# Altium schematic sheet RK3588-HDMI-Connector.SchDoc
size 420 x 297 mm; SheetNumber: 18; SheetTotal: 22
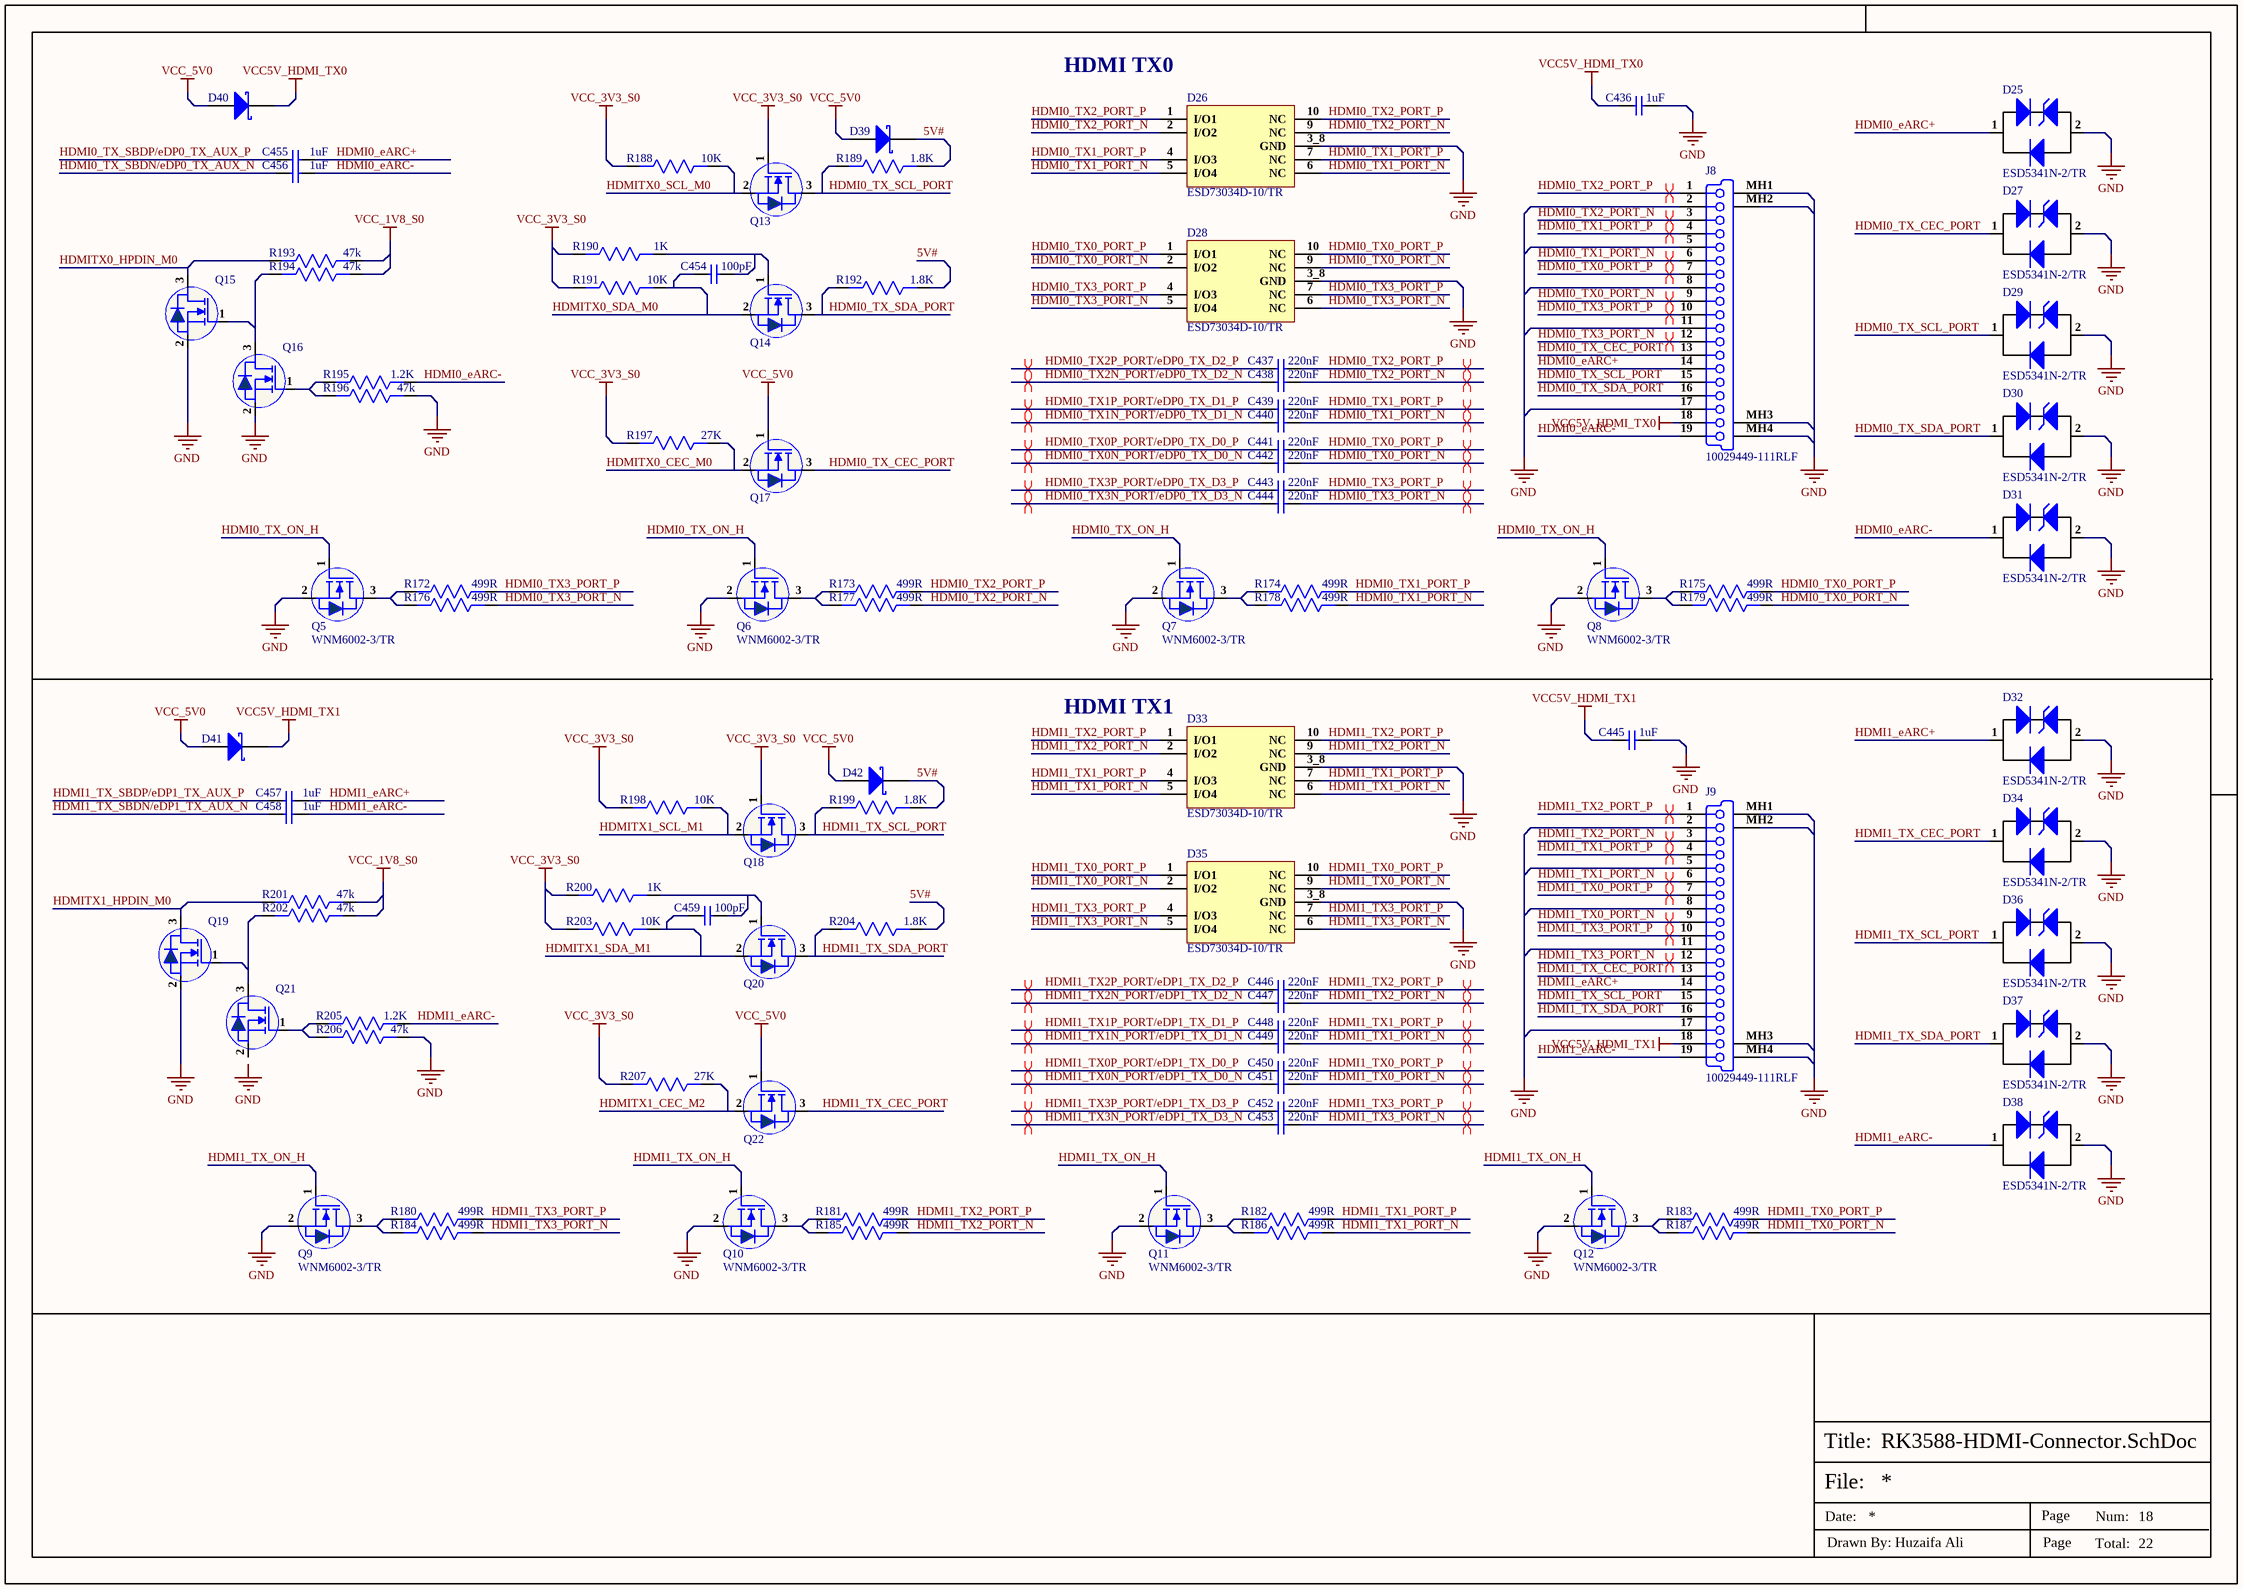
[diagram p0: RK3588-HDMI-Connector.SchDoc]

## Parts
C436  1uF  [Cap-0402]
C437  220nF  [CAP-0201]
C438  220nF  [CAP-0201]
C439  220nF  [CAP-0201]
C440  220nF  [CAP-0201]
C441  220nF  [CAP-0201]
C442  220nF  [CAP-0201]
C443  220nF  [CAP-0201]
C444  220nF  [CAP-0201]
C445  1uF  [Cap-0402]
C446  220nF  [CAP-0201]
C447  220nF  [CAP-0201]
C448  220nF  [CAP-0201]
C449  220nF  [CAP-0201]
C450  220nF  [CAP-0201]
C451  220nF  [CAP-0201]
C452  220nF  [CAP-0201]
C453  220nF  [CAP-0201]
C454  100pF  [Cap-0402]
C455  1uF  [Cap-0201]
C456  1uF  [Cap-0201]
C457  1uF  [Cap-0201]
C458  1uF  [Cap-0201]
C459  100pF  [Cap-0402]
D25  ESD5341N-2/TR  [DFN1006-2L_]
D26  ESD73034D-10/TR  [DFN2510-10L_]
D27  ESD5341N-2/TR  [DFN1006-2L_]
D28  ESD73034D-10/TR  [DFN2510-10L_]
D29  ESD5341N-2/TR  [DFN1006-2L_]
D30  ESD5341N-2/TR  [DFN1006-2L_]
D31  ESD5341N-2/TR  [DFN1006-2L_]
D32  ESD5341N-2/TR  [DFN1006-2L_]
D33  ESD73034D-10/TR  [DFN2510-10L_]
D34  ESD5341N-2/TR  [DFN1006-2L_]
D35  ESD73034D-10/TR  [DFN2510-10L_]
D36  ESD5341N-2/TR  [DFN1006-2L_]
D37  ESD5341N-2/TR  [DFN1006-2L_]
D38  ESD5341N-2/TR  [DFN1006-2L_]
D39  B5819WS  [SOD-323]  (value not drawn)
D40  B5819WS  [SOD-323]  (value not drawn)
D41  B5819WS  [SOD-323]  (value not drawn)
D42  B5819WS  [SOD-323]  (value not drawn)
J8  10029449-111RLF  [10029449-111RLF]
J9  10029449-111RLF  [10029449-111RLF]
Q5  WNM6002-3/TR  [SOT_323]
Q6  WNM6002-3/TR  [SOT_323]
Q7  WNM6002-3/TR  [SOT_323]
Q8  WNM6002-3/TR  [SOT_323]
Q9  WNM6002-3/TR  [SOT_323]
Q10  WNM6002-3/TR  [SOT_323]
Q11  WNM6002-3/TR  [SOT_323]
Q12  WNM6002-3/TR  [SOT_323]
Q13  2SK3018T106  [SOT_323]  (value not drawn)
Q14  2SK3018T106  [SOT_323]  (value not drawn)
Q15  2SK3018T106  [SOT_323]  (value not drawn)
Q16  2SK3018T106  [SOT_323]  (value not drawn)
Q17  2SK3018T106  [SOT_323]  (value not drawn)
Q18  2SK3018T106  [SOT_323]  (value not drawn)
Q19  2SK3018T106  [SOT_323]  (value not drawn)
Q20  2SK3018T106  [SOT_323]  (value not drawn)
Q21  2SK3018T106  [SOT_323]  (value not drawn)
Q22  2SK3018T106  [SOT_323]  (value not drawn)
R172  499R  [Res-0201]
R173  499R  [Res-0201]
R174  499R  [Res-0201]
R175  499R  [Res-0201]
R176  499R  [Res-0201]
R177  499R  [Res-0201]
R178  499R  [Res-0201]
R179  499R  [Res-0201]
R180  499R  [Res-0201]
R181  499R  [Res-0201]
R182  499R  [Res-0201]
R183  499R  [Res-0201]
R184  499R  [Res-0201]
R185  499R  [Res-0201]
R186  499R  [Res-0201]
R187  499R  [Res-0201]
R188  10K  [Res-0402]
R189  1.8K  [Res-0402]
R190  1K  [Res-0402]
R191  10K  [Res-0402]
R192  1.8K  [Res-0402]
R193  47k  [Res-0402]
R194  47k  [Res-0402]
R195  1.2K  [Res-0402]
R196  47k  [Res-0402]
R197  27K  [Res-0402]
R198  10K  [Res-0402]
R199  1.8K  [Res-0402]
R200  1K  [Res-0402]
R201  47k  [Res-0402]
R202  47k  [Res-0402]
R203  10K  [Res-0402]
R204  1.8K  [Res-0402]
R205  1.2K  [Res-0402]
R206  47k  [Res-0402]
R207  27K  [Res-0402]

## Nets
GND: C436.2 C445.2 D25.2(A) D26.3_8(GND) D27.2(A) D28.3_8(GND) D29.2(A) D30.2(A) D31.2(A) D32.2(A) D33.3_8(GND) D34.2(A) D35.3_8(GND) D36.2(A) D37.2(A) D38.2(A) J8.2 J8.5 J8.8 J8.11 J8.17 J8.MH1(Tab) J8.MH2(Tab) J8.MH3(Tab) J8.MH4(Tab) J9.2 J9.5 J9.8 J9.11 J9.17 J9.MH1(Tab) J9.MH2(Tab) J9.MH3(Tab) J9.MH4(Tab) Q5.2(S) Q6.2(S) Q7.2(S) Q8.2(S) Q9.2(S) Q10.2(S) Q11.2(S) Q12.2(S) Q15.2(S) Q16.2(S) Q19.2(S) R196.1 R206.1
VCC5V_HDMI_TX0: C436.1 D40.1(K) J8.18
VCC5V_HDMI_TX1: C445.1 D41.1(K) J9.18
VCC_1V8_S0: R193.1 R194.1 R201.1 R202.1
VCC_3V3_S0: Q13.1(G) Q18.1(G) R188.2 R190.2 R191.2 R197.2 R198.2 R200.2 R203.2 R207.2
VCC_5V0: D39.2(A) D40.2(A) D41.2(A) D42.2(A) Q17.1(G) Q22.1(G)
5V#: D39.1(K) D42.1(K) R189.1 R192.1 R199.1 R204.1
HDMI0_eARC+: C455.2 D25.1(K) J8.14
HDMI0_eARC-: C456.2 D31.1(K) J8.19 R195.1
HDMI0_TX0_PORT_N: C442.2 D28.2(I/O2) D28.9(NC) J8.9 R179.1
HDMI0_TX0_PORT_P: C441.2 D28.1(I/O1) D28.10(NC) J8.7 R175.1
HDMI0_TX0N_PORT/eDP0_TX_D0_N: C442.1
HDMI0_TX0P_PORT/eDP0_TX_D0_P: C441.1
HDMI0_TX1_PORT_N: C440.2 D26.5(I/O4) D26.6(NC) J8.6 R178.1
HDMI0_TX1_PORT_P: C439.2 D26.4(I/O3) D26.7(NC) J8.4 R174.1
HDMI0_TX1N_PORT/eDP0_TX_D1_N: C440.1
HDMI0_TX1P_PORT/eDP0_TX_D1_P: C439.1
HDMI0_TX2_PORT_N: C438.2 D26.2(I/O2) D26.9(NC) J8.3 R177.1
HDMI0_TX2_PORT_P: C437.2 D26.1(I/O1) D26.10(NC) J8.1 R173.1
HDMI0_TX2N_PORT/eDP0_TX_D2_N: C438.1
HDMI0_TX2P_PORT/eDP0_TX_D2_P: C437.1
HDMI0_TX3_PORT_N: C444.2 D28.5(I/O4) D28.6(NC) J8.12 R176.1
HDMI0_TX3_PORT_P: C443.2 D28.4(I/O3) D28.7(NC) J8.10 R172.1
HDMI0_TX3N_PORT/eDP0_TX_D3_N: C444.1
HDMI0_TX3P_PORT/eDP0_TX_D3_P: C443.1
HDMI0_TX_CEC_PORT: D27.1(K) J8.13 Q17.3(D)
HDMI0_TX_ON_H: Q5.1(G) Q6.1(G) Q7.1(G) Q8.1(G)
HDMI0_TX_SBDN/eDP0_TX_AUX_N: C456.1
HDMI0_TX_SBDP/eDP0_TX_AUX_P: C455.1
HDMI0_TX_SCL_PORT: D29.1(K) J8.15 Q13.3(D) R189.2
HDMI0_TX_SDA_PORT: D30.1(K) J8.16 Q14.3(D) R192.2
HDMI1_eARC+: C457.2 D32.1(K) J9.14
HDMI1_eARC-: C458.2 D38.1(K) J9.19 R205.1
HDMI1_TX0_PORT_N: C451.2 D35.2(I/O2) D35.9(NC) J9.9 R187.1
HDMI1_TX0_PORT_P: C450.2 D35.1(I/O1) D35.10(NC) J9.7 R183.1
HDMI1_TX0N_PORT/eDP1_TX_D0_N: C451.1
HDMI1_TX0P_PORT/eDP1_TX_D0_P: C450.1
HDMI1_TX1_PORT_N: C449.2 D33.5(I/O4) D33.6(NC) J9.6 R186.1
HDMI1_TX1_PORT_P: C448.2 D33.4(I/O3) D33.7(NC) J9.4 R182.1
HDMI1_TX1N_PORT/eDP1_TX_D1_N: C449.1
HDMI1_TX1P_PORT/eDP1_TX_D1_P: C448.1
HDMI1_TX2_PORT_N: C447.2 D33.2(I/O2) D33.9(NC) J9.3 R185.1
HDMI1_TX2_PORT_P: C446.2 D33.1(I/O1) D33.10(NC) J9.1 R181.1
HDMI1_TX2N_PORT/eDP1_TX_D2_N: C447.1
HDMI1_TX2P_PORT/eDP1_TX_D2_P: C446.1
HDMI1_TX3_PORT_N: C453.2 D35.5(I/O4) D35.6(NC) J9.12 R184.1
HDMI1_TX3_PORT_P: C452.2 D35.4(I/O3) D35.7(NC) J9.10 R180.1
HDMI1_TX3N_PORT/eDP1_TX_D3_N: C453.1
HDMI1_TX3P_PORT/eDP1_TX_D3_P: C452.1
HDMI1_TX_CEC_PORT: D34.1(K) J9.13 Q22.3(D)
HDMI1_TX_ON_H: Q9.1(G) Q10.1(G) Q11.1(G) Q12.1(G)
HDMI1_TX_SBDN/eDP1_TX_AUX_N: C458.1
HDMI1_TX_SBDP/eDP1_TX_AUX_P: C457.1
HDMI1_TX_SCL_PORT: D36.1(K) J9.15 Q18.3(D) R199.2
HDMI1_TX_SDA_PORT: D37.1(K) J9.16 Q20.3(D) R204.2
HDMITX0_CEC_M0: Q17.2(S) R197.1
HDMITX0_HPDIN_M0: Q15.3(D) R193.2
HDMITX0_SCL_M0: Q13.2(S) R188.1
HDMITX0_SDA_M0: C454.1 Q14.2(S) R191.1
HDMITX1_CEC_M2: Q22.2(S) R207.1
HDMITX1_HPDIN_M0: Q19.3(D) R201.2
HDMITX1_SCL_M1: Q18.2(S) R198.1
HDMITX1_SDA_M1: C459.1 Q20.2(S) R203.1
NetC454_2: C454.2 Q14.1(G) R190.1
NetC459_2: C459.2 Q20.1(G) R200.1
NetQ5_3: Q5.3(D) R172.2 R176.2
NetQ6_3: Q6.3(D) R173.2 R177.2
NetQ7_3: Q7.3(D) R174.2 R178.2
NetQ8_3: Q8.3(D) R175.2 R179.2
NetQ9_3: Q9.3(D) R180.2 R184.2
NetQ10_3: Q10.3(D) R181.2 R185.2
NetQ11_3: Q11.3(D) R182.2 R186.2
NetQ12_3: Q12.3(D) R183.2 R187.2
NetQ15_1: Q15.1(G) Q16.3(D) R194.2
NetQ16_1: Q16.1(G) R195.2 R196.2
NetQ19_1: Q19.1(G) Q21.3(D) R202.2
NetQ21_1: Q21.1(G) R205.2 R206.2

Not connected (* = marked no-connect by the designer): Q21 2(S)

## Layout directives
differential pair: HDMI0_TX0_PORT_N, HDMI0_TX0_PORT_P, HDMI0_TX0N_PORT/eDP0_TX_D0_N, HDMI0_TX0P_PORT/eDP0_TX_D0_P, HDMI0_TX1_PORT_N, HDMI0_TX1_PORT_P, HDMI0_TX1N_PORT/eDP0_TX_D1_N, HDMI0_TX1P_PORT/eDP0_TX_D1_P, HDMI0_TX2_PORT_N, HDMI0_TX2_PORT_P, HDMI0_TX2N_PORT/eDP0_TX_D2_N, HDMI0_TX2P_PORT/eDP0_TX_D2_P, HDMI0_TX3_PORT_N, HDMI0_TX3_PORT_P, HDMI0_TX3N_PORT/eDP0_TX_D3_N, HDMI0_TX3P_PORT/eDP0_TX_D3_P, HDMI1_TX0_PORT_N, HDMI1_TX0_PORT_P, HDMI1_TX0N_PORT/eDP1_TX_D0_N, HDMI1_TX0P_PORT/eDP1_TX_D0_P, HDMI1_TX1_PORT_N, HDMI1_TX1_PORT_P, HDMI1_TX1N_PORT/eDP1_TX_D1_N, HDMI1_TX1P_PORT/eDP1_TX_D1_P, HDMI1_TX2_PORT_N, HDMI1_TX2_PORT_P, HDMI1_TX2N_PORT/eDP1_TX_D2_N, HDMI1_TX2P_PORT/eDP1_TX_D2_P, HDMI1_TX3_PORT_N, HDMI1_TX3_PORT_P, HDMI1_TX3N_PORT/eDP1_TX_D3_N, HDMI1_TX3P_PORT/eDP1_TX_D3_P

## Notes on the sheet
- (near D26) HDMI TX0
- (near D33) HDMI TX1
- Labels drawn without touching a wire or pin: GND
- File:
- Title:
- Date:
- Page
- Num:
- Total:
- Drawn By: Huzaifa Ali

## Library data of the parts
C436 C445 = CC0402KRX5R6BB105: CAP CER 1UF 10V X5R 0402; Manufacturer: Yageo; Tolerance: 10%; Dissipation Factor: 15%; Supplier 1: Mouser; Manufacturer Part Number: CC0402KRX5R6BB105; RoHS: Yes; Category: Ceramic Capacitors; Stock 1: 6711367; Pricing 1: 1=0.11000, 10=0.05500, 50=0.05500, 100=0.03300, 500=0.02700, 1000=0.02200, 2500=0.02100, 10000=0.01800 (USD); Mount: Surface Mount; Case/Package: 0402; Number of Pins: 2; Case Code (Metric): 1005; Case Code (Imperial): 0402; Min Operating Temperature: -55°C; Max Operating Temperature: 85°C; Capacitance: 1uF; Dielectric: X5R; Package Quantity: 1; Voltage Rating: 10V; Packaging: Tape and Reel; Voltage Rating (DC): 10V; Termination: SMD/SMT; Resistor Type: Ceramic; Series: CC; Construction: Flat; Length: 1mm; Width: 0.02inch; Height: 0.5mm; Thickness: 0.022inch; Depth: 0.5mm; Radiation Hardening: No; REACH SVHC: No SVHC; Lead Free: Lead Free; Halogen Free: Halogen Free; RoHS Compliant: Yes; ComponentLink1URL: https://datasheet.ciiva.com/176/upy-gphc-x5r-4v-to-50v-12-176704.pdf?src-supplier=Digi-Key; ComponentLink1Description: https://datasheet.ciiva.com/176/upy-gphc-x5r-4v-to-50v-12-176704.pdf?src-supplier=Digi-Key; ComponentLink2URL: https://datasheet.ciiva.com/176/mlccorderingcode-176705.pdf?src-supplier=Digi-Key; ComponentLink2Description: https://datasheet.ciiva.com/176/mlccorderingcode-176705.pdf?src-supplier=Digi-Key; ComponentLink3URL: https://datasheet.ciiva.com/176/mlccorderingcode-176706.pdf?src-supplier=Digi-Key; ComponentLink3Description: https://datasheet.ciiva.com/176/mlccorderingcode-176706.pdf?src-supplier=Digi-Key; Supplier Part Number 1: 603-CC402KRX5R6BB105; LCSC Part Number: C106254
C437-C444 C446-C453 = CC0201KRX5R6BB224: CAP CER 0.22UF 10V X5R 0201; Manufacturer: Yageo; Supplier 1: Digi-Key; Manufacturer Part Number: CC0201KRX5R6BB224; RoHS: Yes; Category: Ceramic Capacitors; Stock 1: 4746; Pricing 1: 1=0.10000, 10=0.06700, 50=0.03640, 100=0.02970, 500=0.02120, 1000=0.01666, 2500=0.01515, 5000=0.01394 (USD); RoHS Compliant: Yes; Supplier Part Number 1: 13-CC0201KRX5R6BB224CT-ND
C454 C459 = GRM1555C1H101JA01D: CAP CER 100PF 50V C0G/NP0 0402; Manufacturer: Murata; Material: Ceramic; Dielectric: C0G; Tolerance: 5%; Supplier 1: Mouser; Manufacturer Part Number: GRM1555C1H101JA01D; RoHS: Yes; Category: Ceramic Capacitors; Stock 1: 2073105; Pricing 1: 1=0.10000, 10=0.01000, 50=0.01000, 100=0.00900, 500=0.00600, 1000=0.00500, 2500=0.00400, 10000=0.00300, 50000=0.00200 (USD); Mount: Surface Mount; Case/Package: 0402; Case Code (Metric): 1005; Case Code (Imperial): 0402; Min Operating Temperature: -55°C; Max Operating Temperature: 125°C; Voltage Rating: 50V; Capacitance: 100pF; Packaging: Tape and Reel; Package Quantity: 1; Voltage Rating (DC): 50V; Termination: SMD/SMT; Series: GRM; Construction: Flat; Voltage: 50V; Length: 1mm; Width: 0.02inch; Height: 0.5mm; Thickness: 0.022inch; Depth: 0.5mm; Radiation Hardening: No; REACH SVHC: No SVHC; Lead Free: Lead Free; RoHS Compliant: Yes; ComponentLink1URL: https://datasheet.ciiva.com/11786/0900766b80ef921d-11786069.pdf?src-supplier=RSComponents; ComponentLink1Description: https://datasheet.ciiva.com/11786/0900766b80ef921d-11786069.pdf?src-supplier=RSComponents; ComponentLink2URL: https://datasheet.ciiva.com/18184/getdatasheetpartid-199957-18184175.pdf?src-supplier=Verical; ComponentLink2Description: https://datasheet.ciiva.com/18184/getdatasheetpartid-199957-18184175.pdf?src-supplier=Verical; ComponentLink3URL: https://datasheet.ciiva.com/29200/453557-da-01-en-vs-kondensator-0402-29200111.pdf?src-supplier=Conrad; ComponentLink3Description: https://datasheet.ciiva.com/29200/453557-da-01-en-vs-kondensator-0402-29200111.pdf?src-supplier=Conrad; ComponentLink4URL: https://datasheet.ciiva.com/6271/partnumbering-e-01-6271071.pdf?src-supplier=Digi-Key; ComponentLink4Description: https://datasheet.ciiva.com/6271/partnumbering-e-01-6271071.pdf?src-supplier=Digi-Key; ComponentLink5URL: https://datasheet.ciiva.com/16440/product-16440566.pdf?src-supplier=Future+Electronics; ComponentLink5Description: https://datasheet.ciiva.com/16440/product-16440566.pdf?src-supplier=Future+Electronics; Supplier Part Number 1: 81-GRM1555C1H101JA1D; LCSC Part Number: C77177
C455-C458 = CC0201KRX5R5BB105: CAP CER 1UF 6.3V X5R 0201; Manufacturer: Yageo; Tolerance: 10%; Item Type: Capacitor; Supplier 1: Arrow Electronics; Manufacturer Part Number: CC0201KRX5R5BB105; RoHS: Yes; Category: Ceramic Capacitors; Stock 1: 600000; Pricing 1: 15000=0.00740 (USD); Mount: Surface Mount; Case/Package: 0201; Case Code (Imperial): 0201; Case Code (Metric): 0603; Min Operating Temperature: -55°C; Max Operating Temperature: 85°C; Packaging: Cut Tape; Capacitance: 1uF; Voltage Rating: 6.3V; RoHS Compliant: Yes; ComponentLink1URL: http://www.yageo.com/documents/recent/UPY-GPHC_X5R_4V-to-50V_25.pdf?src-supplier=Digi-Key; ComponentLink1Description: http://www.yageo.com/documents/recent/UPY-GPHC_X5R_4V-to-50V_25.pdf?src-supplier=Digi-Key; ComponentLink2URL: https://www.yageo.com/upload/media/product/productsearch/datasheet/mlcc/UPY-GPHC_X5R_4V-to-50V_26.pdf?src-supplier=Digi-Key; ComponentLink2Description: https://www.yageo.com/upload/media/product/productsearch/datasheet/mlcc/UPY-GPHC_X5R_4V-to-50V_26.pdf?src-supplier=Digi-Key; Supplier Part Number 1: CC0201KRX5R5BB105; LCSC Part Number: C541330
D25 D27 D29-D32 D34 D36-D38 = ESD5341N-2/TR: 4A@8/20us 15V 7V 5V Unidirectional DFN1006-2L TVS ROHS; Manufacturer: WILLSEMI; Item Type: Diode; Manufacturer Part Number: ESD5341N-2/TR; Package: DFN1006-2L; ComponentLink1Description: LCSC; ComponentLink1URL: https://www.lcsc.com/product-detail/TVS_WILLSEMI-Will-Semicon-ESD5341N-2-TR_C239773.html; LCSC Part Number: C239773
D26 D28 D33 D35 = ESD73034D-10/TR: DFN2510-10L ESD Protection Devices ROHS; Manufacturer: WILLSEMI; Item Type: Diode; Manufacturer Part Number: ESD73034D-10/TR; Package: DFN2510-10L; LCSC Part Number: C2941834; ComponentLink1Description: LCSC; ComponentLink1URL: https://www.lcsc.com/product-detail/span-style-background-color-ff0-ESD-span-Protection-Devices_WILLSEMI-Will-Semicon-ESD73034D-10-TR_C2941834.html
D39-D42 = B5819WS: DIODE SCHOTTKY 40V 1A SOD323; Manufacturer: MDD; Manufacturer Part Number: B5819WS-TP; Max Surge Current: 10A; Forward Voltage: 900mV; Max Reverse Leakage Current: 1mA; Element Configuration: Single; Supplier 1: Arrow Electronics; RoHS: Yes; Category: Rectifier Diodes; Stock 1: 1701; Pricing 1: 1=0.34370, 10=0.18990, 25=0.18810, 100=0.11820, 250=0.11700, 500=0.08890, 1000=0.07420 (USD); Mount: Surface Mount; Number of Pins: 2; Min Operating Temperature: -65°C; Max Operating Temperature: 125°C; Package Quantity: 1; Packaging: Tape and Reel; Average Rectified Current: 1A; Peak Non-Repetitive Surge Current: 10A; Max Reverse Voltage (DC): 40V; Series: -; Radiation Hardening: No; RoHS Compliant: Yes; Lead Free: Lead Free; Supplier Part Number 1: B5819WS-TP; ComponentLink1Description: LCSC; ComponentLink1URL: https://lcsc.com/product-detail/Schottky-Barrier-Diodes-SBD_MDD-Microdiode-Electronics-B5819WS_C64886.html; LCSC Part Number: C22624; Item Type: Diode
J8 J9 = 10029449-111RLF: CONN RCPT 1.4 HDMI 19POS SMD R/A; Manufacturer: Amphenol ICC / FCI; Item Type: Connector; Supplier 1: RSComponents; Manufacturer Part Number: 10029449-111RLF; RoHS: No; Category: Audio / Video Connectors; Stock 1: 6150; Pricing 1: 1=1471.56000 (GBP); ComponentLink1URL: https://www.verical.com/server-webapp/html/getDatasheet?partID=416866&src-supplier=Verical; ComponentLink1Description: https://www.verical.com/server-webapp/html/getDatasheet?partID=416866&src-supplier=Verical; ComponentLink2URL: http://components.arrow.com/part/dataview/51683435S9285512N8314?src-supplier=Arrow+Electronics; ComponentLink2Description: http://components.arrow.com/part/dataview/51683435S9285512N8314?src-supplier=Arrow+Electronics; ComponentLink3URL: http://portal.fciconnect.com/Comergent/en/US/adirect/fci?cmd=catProductDetail&showAddButton=true&productID=10029449111RLF&src-supplier=Mouser; ComponentLink3Description: http://portal.fciconnect.com/Comergent/en/US/adirect/fci?cmd=catProductDetail&showAddButton=true&productID=10029449111RLF&src-supplier=Mouser; ComponentLink4URL: http://www.amphenol-icc.com/media/wysiwyg/files/drawing/10029449.pdf?src-supplier=Digi-Key; ComponentLink4Description: http://www.amphenol-icc.com/media/wysiwyg/files/drawing/10029449.pdf?src-supplier=Digi-Key; ComponentLink5URL: http://www.farnell.com/datasheets/2562284.pdf?src-supplier=Farnell; ComponentLink5Description: http://www.farnell.com/datasheets/2562284.pdf?src-supplier=Farnell; Supplier Part Number 1: 1822113; LCSC Part Number: C427307
Q5-Q12 = WNM6002-3/TR: 60V 300mA 2Ω@10V,370mA 370mW 2V@250uA N Channel SOT-323 MOSFETs ROHS; Manufacturer: WILLSEMI; Item Type: Mosfet; ComponentLink1Description: LCSC; ComponentLink1URL: https://www.lcsc.com/product-detail/MOSFETs_WILLSEMI-Will-Semicon-WNM6002-3-TR_C501342.html; Manufacturer Part Number: WNM6002-3/TR; Package: SOT-323; LCSC Part Number: C501342
Q13-Q22 = 2SK3018T106: MOSFET N-CH 30V .1A SOT-323; Manufacturer: Rohm; Rise Time: 35ns; Nominal Vgs: 1.5V; Rds On Max: 8R; Input Capacitance: 13pF; Continuous Drain Current (ID): 100mA; Power Dissipation: 200mW; Drain to Source Resistance: 7R; Turn-Off Delay Time: 80ns; Turn-On Delay Time: 15ns; Element Configuration: Single; Gate to Source Voltage (Vgs): 20V; On-State Resistance: 13R; Polarity: N-CHANNEL; Supplier 1: Digi-Key; Manufacturer Part Number: 2SK3018T106; RoHS: Yes; Category: MOSFETs; Stock 1: 35632; Pricing 1: 1=0.40000, 10=0.33100, 100=0.17560, 500=0.11550, 1000=0.07854 (USD); Mount: Surface Mount; Case/Package: SOT-323; Number of Pins: 3; Contact Plating: Copper,Tin,Silver; Min Operating Temperature: -55°C; Max Operating Temperature: 150°C; Package Quantity: 3000; Packaging: Tape and Reel; Dual Supply Voltage: 30V; Drain to Source Breakdown Voltage: 30V; Fall Time: 35ns; Drain to Source Voltage (Vdss): 30V; Max Power Dissipation: 200mW; Threshold Voltage: 1.5V; Termination: SMD/SMT; Voltage Rating (DC): 30V; Current Rating: 100mA; Drain-source On Resistance-Max: 13R; Series: -; Length: 2mm; Width: 1.25mm; Height: 0.8mm; Radiation Hardening: No; Reach SVHC Compliant: Yes; Lead Free: Lead Free; RoHS Compliant: Yes; ComponentLink1URL: https://datasheet.ciiva.com/16307/2sk3018-16307708.pdf?src-supplier=Future+Electronics; ComponentLink1Description: https://datasheet.ciiva.com/16307/2sk3018-16307708.pdf?src-supplier=Future+Electronics; ComponentLink2URL: https://datasheet.ciiva.com/13043/2sk3018-209190-13043441.pdf?src-supplier=Mouser; ComponentLink2Description: https://datasheet.ciiva.com/13043/2sk3018-209190-13043441.pdf?src-supplier=Mouser; ComponentLink3URL: https://datasheet.ciiva.com/1188/2sk3018-1188589.pdf?src-supplier=Element14; ComponentLink3Description: https://datasheet.ciiva.com/1188/2sk3018-1188589.pdf?src-supplier=Element14; ComponentLink4URL: https://datasheet.ciiva.com/934/2sk3018-934635.pdf?src-supplier=Digi-Key; ComponentLink4Description: https://datasheet.ciiva.com/934/2sk3018-934635.pdf?src-supplier=Digi-Key; ComponentLink5URL: https://datasheet.ciiva.com/934/2sk3018-934636.pdf?src-supplier=Digi-Key; ComponentLink5Description: https://datasheet.ciiva.com/934/2sk3018-934636.pdf?src-supplier=Digi-Key; LCSC Part Number: C113315; Item Type: Mosfet; Supplier Part Number 1: 2SK3018T106CT-ND
R172-R187 = RC0201FR-07499RL: RES 499 OHM 1% 1/20W 0201; Manufacturer: Yageo; Max Power Dissipation: 50mW; Temperature Coefficient: 200ppm/°C; Supplier 1: Digi-Key; Manufacturer Part Number: RC0201FR-07499RL; RoHS: Yes; Category: Chip SMD Resistors; Stock 1: 756142; Pricing 1: 1=0.10000, 10=0.03700, 100=0.01500, 1000=0.00672, 2500=0.00583, 5000=0.00482 (USD); Case/Package: 0201; Case Code (Metric): 0603; Case Code (Imperial): 0201; Min Operating Temperature: -55°C; Max Operating Temperature: 125°C; Resistance: 499R; Tolerance: 1%; Packaging: Tape and Reel; Resistor Type: Thick Film; Number of Terminations: 2; Features: Moisture Resistant; Length: 0.024inch; Width: 0.012inch; Height: 0.01inch; Depth: 0.3mm; Military Standard: Not; Lead Free: Lead Free; RoHS Compliant: Yes; ComponentLink1URL: http://www.yageo.com/documents/recent/PYu-RC_Group_51_RoHS_L_10.pdf?src-supplier=Digi-Key; ComponentLink1Description: http://www.yageo.com/documents/recent/PYu-RC_Group_51_RoHS_L_10.pdf?src-supplier=Digi-Key; ComponentLink2URL: http://www.yageo.com/documents/recent/PYu-RC_Group_51_RoHS_L_9.pdf?src-supplier=Digi-Key; ComponentLink2Description: http://www.yageo.com/documents/recent/PYu-RC_Group_51_RoHS_L_9.pdf?src-supplier=Digi-Key; Supplier Part Number 1: YAG2700CT-ND
R188 R191 R198 R203 = RC0402FR-0710KL: RES 10K OHM 1% 1/16W 0402; Manufacturer: Yageo; Resistance: 10kR; Voltage Rating (DC): 50V; Temperature Coefficient: 100ppm/°C; Power Rating: 62.5mW; Max Power Dissipation: 63mW; Supplier 1: Mouser; Manufacturer Part Number: RC0402FR-0710KL; RoHS: Yes; Category: Chip SMD Resistors; Stock 1: 18648329; Pricing 1: 1=0.10000, 10=0.01400, 50=0.01400, 100=0.00500, 1000=0.00300, 10000=0.00200 (USD); Case/Package: 0402; Number of Pins: 2; Case Code (Imperial): 0402; Case Code (Metric): 1005; Min Operating Temperature: -55°C; Max Operating Temperature: 155°C; Resistor Type: Thick Film; Tolerance: 1%; Packaging: Tape and Reel; Voltage Rating: 50V; Termination: SMD/SMT; Working Voltage: 50V; Number of Terminations: 2; Features: Moisture Resistant; Series: RC; Resistance Tolerance: 1%; Construction: Rectangular; Length: 1mm; Width: 0.5mm; Height: 0.32mm; Depth: 0.5mm; Lead Pitch: 0.2mm; REACH SVHC: No SVHC; Lead Free: Lead Free; RoHS Compliant: Yes; Military Standard: Not; ComponentLink1URL: https://datasheet.ciiva.com/7660/38568-7660787.pdf?src-supplier=Element14; ComponentLink1Description: https://datasheet.ciiva.com/7660/38568-7660787.pdf?src-supplier=Element14; ComponentLink2URL: https://datasheet.ciiva.com/7849/1686128-7849814.pdf?src-supplier=Element14; ComponentLink2Description: https://datasheet.ciiva.com/7849/1686128-7849814.pdf?src-supplier=Element14; ComponentLink3URL: https://datasheet.ciiva.com/7983/1018594-7983486.pdf?src-supplier=Element14; ComponentLink3Description: https://datasheet.ciiva.com/7983/1018594-7983486.pdf?src-supplier=Element14; ComponentLink4URL: https://datasheet.ciiva.com/22747/1018594-22747512.pdf?src-supplier=Element14; ComponentLink4Description: https://datasheet.ciiva.com/22747/1018594-22747512.pdf?src-supplier=Element14; ComponentLink5URL: https://datasheet.ciiva.com/12667/pyu-rc0402-51-rohs-l-6-r-12667067.pdf?src-supplier=Mouser; ComponentLink5Description: https://datasheet.ciiva.com/12667/pyu-rc0402-51-rohs-l-6-r-12667067.pdf?src-supplier=Mouser; ComponentLink6URL: https://datasheet.ciiva.com/7849/1784430-7849813.pdf?src-supplier=Element14; ComponentLink6Description: https://datasheet.ciiva.com/7849/1784430-7849813.pdf?src-supplier=Element14; ComponentLink7URL: https://datasheet.ciiva.com/7849/1784430-7849815.pdf?src-supplier=Element14; ComponentLink7Description: https://datasheet.ciiva.com/7849/1784430-7849815.pdf?src-supplier=Element14; Supplier Part Number 1: 603-RC0402FR-0710KL; LCSC Part Number: C60490
R189 R192 R199 R204 = RCS04021K80FKED: RES SMD 1.8K OHM 1% 1/5W 0402; Manufacturer: Vishay Dale; Resistance: 1.8kR; Max Power Dissipation: 200mW; Temperature Coefficient: 100ppm/°C; Supplier 1: Digi-Key; Manufacturer Part Number: RCS04021K80FKED; Stock 1: 1940; Pricing 1: 1=0.12, 10=0.105, 100=0.0402, 1000=0.01771, 2500=0.0153, 5000=0.01368 (USD); Case/Package: 0402; Min Operating Temperature: -55°C; Max Operating Temperature: 155°C; Package Quantity: 10000; Packaging: Tape and Reel; Resistor Type: Thick Film; Number of Terminations: 2; Tolerance: 1%; Features: Automotive AEC-Q200; Length: 0.039inch; Width: 0.02inch; Height: 0.016inch; ComponentLink1URL: http://www.vishay.com/docs/20065/rcse3.pdf?src-supplier=Digi-Key; ComponentLink1Description: http://www.vishay.com/docs/20065/rcse3.pdf?src-supplier=Digi-Key; Supplier Part Number 1: 541-RCS04021K80FKEDDKR-ND; LCSC Part Number: C1881088
R190 R200 = RC0402FR-071KL: RES 1K OHM 1% 1/16W 0402; Manufacturer: Yageo; Resistance: 1kR; Temperature Coefficient: 100ppm/°C; Voltage Rating (DC): 50V; Power Rating: 62.5mW; Max Power Dissipation: 63mW; Item Type: Resistor; Supplier 1: Avnet; Manufacturer Part Number: RC0402FR-071KL; RoHS: Yes; Category: Chip SMD Resistors; Stock 1: 13030000; Pricing 1: 10000=0.00085, 20000=0.00087, 40000=0.00084, 60000=0.00083, 80000=0.00079, 100000=0.00078, 1000000=0.00076 (USD); Case/Package: 0402; Number of Pins: 2; Case Code (Imperial): 0402; Case Code (Metric): 1005; Size Code: 0402; Min Operating Temperature: -55°C; Max Operating Temperature: 155°C; Resistor Type: Thick Film; Tolerance: 1%; Packaging: Tape and Reel; Voltage Rating: 50V; Termination: SMD/SMT; Features: Moisture Resistant; Series: RC; Number of Terminations: 2; Resistance Tolerance: 1%; Construction: Rectangular; Technology: THICK FILM; Length: 1mm; Width: 0.5mm; Height: 0.32mm; Depth: 0.5mm; Reach SVHC Compliant: Yes; Lead Free: Lead Free; RoHS Compliant: Yes; Military Standard: Not; ComponentLink1URL: https://datasheet.ciiva.com/11819/0900766b80c66297-11819477.pdf?src-supplier=RSComponents; ComponentLink1Description: https://datasheet.ciiva.com/11819/0900766b80c66297-11819477.pdf?src-supplier=RSComponents; ComponentLink2URL: https://datasheet.ciiva.com/7983/1018594-7983502.pdf?src-supplier=Element14; ComponentLink2Description: https://datasheet.ciiva.com/7983/1018594-7983502.pdf?src-supplier=Element14; ComponentLink3URL: https://datasheet.ciiva.com/22747/1018594-22747513.pdf?src-supplier=Element14; ComponentLink3Description: https://datasheet.ciiva.com/22747/1018594-22747513.pdf?src-supplier=Element14; ComponentLink4URL: https://datasheet.ciiva.com/12666/pyu-rc0402-51-rohs-l-6-r-12666741.pdf?src-supplier=Mouser; ComponentLink4Description: https://datasheet.ciiva.com/12666/pyu-rc0402-51-rohs-l-6-r-12666741.pdf?src-supplier=Mouser; ComponentLink5URL: https://datasheet.ciiva.com/7849/1018594-7849869.pdf?src-supplier=Element14; ComponentLink5Description: https://datasheet.ciiva.com/7849/1018594-7849869.pdf?src-supplier=Element14; ComponentLink6URL: https://datasheet.ciiva.com/7849/1018594-7849871.pdf?src-supplier=Element14; ComponentLink6Description: https://datasheet.ciiva.com/7849/1018594-7849871.pdf?src-supplier=Element14; ComponentLink7URL: https://datasheet.ciiva.com/17063/pyu-rc0402-51-rohs-l-6-r-17063193.pdf?src-supplier=Future+Electronics; ComponentLink7Description: https://datasheet.ciiva.com/17063/pyu-rc0402-51-rohs-l-6-r-17063193.pdf?src-supplier=Future+Electronics; Supplier Part Number 1: RC0402FR-071KL; LCSC Part Number: C106235
R193 R194 R196 R201 R202 R206 = RC0402FR-0747KL: RES 47K OHM 1% 1/16W 0402; Manufacturer: Yageo; Power Rating: 62.5mW; Temperature Coefficient: 100ppm/°C; Voltage Rating: 50V; Resistance: 47kR; Max Power Dissipation: 63mW; Supplier 1: Digi-Key; Manufacturer Part Number: RC0402FR-0747KL; RoHS: Yes; Category: Chip SMD Resistors; Stock 1: 5556762; Pricing 1: 1=0.10000, 10=0.01400, 100=0.00580, 1000=0.00262, 2500=0.00228, 5000=0.00188 (USD); Case/Package: 0402; Case Code (Imperial): 0402; Case Code (Metric): 1005; Size Code: 0402; Min Operating Temperature: -55°C; Max Operating Temperature: 155°C; Tolerance: 1%; Series: RC; Packaging: Tape and Reel; Package Quantity: 1; Termination: SMD/SMT; Resistor Type: Thick Film; Number of Terminations: 2; Features: Moisture Resistant; Resistance Tolerance: 1%; Construction: Rectangular; Length: 1mm; Width: 0.02inch; Height: 0.016inch; Depth: 0.5mm; RoHS Compliant: Yes; Military Standard: Not; Lead Free: Lead Free; ComponentLink1URL: https://datasheet.ciiva.com/46412/1018594-46412839.pdf?src-supplier=Element14; ComponentLink1Description: https://datasheet.ciiva.com/46412/1018594-46412839.pdf?src-supplier=Element14; ComponentLink2URL: https://datasheet.ciiva.com/2453/pyu-r-int-thick-7-2453389.pdf?src-supplier=Digi-Key; ComponentLink2Description: https://datasheet.ciiva.com/2453/pyu-r-int-thick-7-2453389.pdf?src-supplier=Digi-Key; ComponentLink3URL: https://datasheet.ciiva.com/2453/pyu-r-int-thick-7-2453390.pdf?src-supplier=Digi-Key; ComponentLink3Description: https://datasheet.ciiva.com/2453/pyu-r-int-thick-7-2453390.pdf?src-supplier=Digi-Key; ComponentLink4URL: https://datasheet.ciiva.com/2453/pyu-r-int-thick-7-2453388.pdf?src-supplier=Digi-Key; ComponentLink4Description: https://datasheet.ciiva.com/2453/pyu-r-int-thick-7-2453388.pdf?src-supplier=Digi-Key; ComponentLink5URL: https://datasheet.ciiva.com/15189/getdatasheetpartid-323748-15189466.pdf?src-supplier=Verical; ComponentLink5Description: https://datasheet.ciiva.com/15189/getdatasheetpartid-323748-15189466.pdf?src-supplier=Verical; ComponentLink6URL: https://datasheet.ciiva.com/16793/pyu-rc0402-51-rohs-l-6-r-16793430.pdf?src-supplier=Future+Electronics; ComponentLink6Description: https://datasheet.ciiva.com/16793/pyu-rc0402-51-rohs-l-6-r-16793430.pdf?src-supplier=Future+Electronics; Supplier Part Number 1: 311-47.0KLRCT-ND
R195 R205 = RC0402FR-071K2L: RES 1.2K OHM 1% 1/16W 0402; Manufacturer: Yageo; Resistance: 1.2kR; Power Rating: 63mW; Voltage Rating: 50V; Temperature Coefficient: 100ppm/°C; Supplier 1: Digi-Key; Manufacturer Part Number: RC0402FR-071K2L; RoHS: Yes; Category: Chip SMD Resistors; Stock 1: 1129636; Pricing 1: 1=0.10000, 10=0.01400, 100=0.00580, 1000=0.00262, 2500=0.00228, 5000=0.00188 (USD); Case/Package: 0402; Case Code (Imperial): 0402; Case Code (Metric): 1005; Size Code: 0402; Min Operating Temperature: -55°C; Max Operating Temperature: 155°C; Tolerance: 1%; Packaging: Tape and Reel; Package Quantity: 1; Termination: SMD/SMT; Resistor Type: Thick Film; Number of Terminations: 2; Max Power Dissipation: 63mW; Features: Moisture Resistant; Series: RC; Construction: Rectangular; Resistance Tolerance: 1%; Technology: THICK FILM; Length: 0.039inch; Width: 0.02inch; Height: 0.016inch; Depth: 0.5mm; Military Standard: Not; Lead Free: Lead Free; RoHS Compliant: Yes; ComponentLink1URL: https://datasheet.ciiva.com/11808/0900766b80c66297-11808455.pdf?src-supplier=RSComponents; ComponentLink1Description: https://datasheet.ciiva.com/11808/0900766b80c66297-11808455.pdf?src-supplier=RSComponents; ComponentLink2URL: https://datasheet.ciiva.com/2453/pyu-r-int-thick-7-2453467.pdf?src-supplier=Digi-Key; ComponentLink2Description: https://datasheet.ciiva.com/2453/pyu-r-int-thick-7-2453467.pdf?src-supplier=Digi-Key; ComponentLink3URL: https://datasheet.ciiva.com/2453/pyu-r-int-thick-7-2453468.pdf?src-supplier=Digi-Key; ComponentLink3Description: https://datasheet.ciiva.com/2453/pyu-r-int-thick-7-2453468.pdf?src-supplier=Digi-Key; ComponentLink4URL: https://datasheet.ciiva.com/2453/pyu-r-int-thick-7-2453466.pdf?src-supplier=Digi-Key; ComponentLink4Description: https://datasheet.ciiva.com/2453/pyu-r-int-thick-7-2453466.pdf?src-supplier=Digi-Key; ComponentLink5URL: https://datasheet.ciiva.com/7849/1018594-7849861.pdf?src-supplier=Element14; ComponentLink5Description: https://datasheet.ciiva.com/7849/1018594-7849861.pdf?src-supplier=Element14; ComponentLink6URL: https://datasheet.ciiva.com/7849/1018594-7849862.pdf?src-supplier=Element14; ComponentLink6Description: https://datasheet.ciiva.com/7849/1018594-7849862.pdf?src-supplier=Element14; ComponentLink7URL: https://datasheet.ciiva.com/15189/getdatasheetpartid-323716-15189366.pdf?src-supplier=Verical; ComponentLink7Description: https://datasheet.ciiva.com/15189/getdatasheetpartid-323716-15189366.pdf?src-supplier=Verical; ComponentLink8URL: https://datasheet.ciiva.com/16745/pyu-rc0402-51-rohs-l-6-r-16745005.pdf?src-supplier=Future+Electronics; ComponentLink8Description: https://datasheet.ciiva.com/16745/pyu-rc0402-51-rohs-l-6-r-16745005.pdf?src-supplier=Future+Electronics; Supplier Part Number 1: 311-1.20KLRCT-ND
R197 R207 = RC0402DR-0727KL: RES 27K OHM 0.5% 1/16W 0402; Manufacturer: Yageo; Resistance: 27kR; Max Power Dissipation: 63mW; Temperature Coefficient: 100ppm/°C; Supplier 1: Mouser; Manufacturer Part Number: RC0402DR-0727KL; RoHS: Yes; Category: Chip SMD Resistors; Pricing 1: 1=0.13000, 10=0.07000, 50=0.07000, 100=0.02900, 1000=0.01300, 10000=0.00700 (USD); Case/Package: 0402; Min Operating Temperature: -55°C; Max Operating Temperature: 155°C; Packaging: Tape and Reel; Resistor Type: Thick Film; Number of Terminations: 2; Tolerance: 0.5%; Features: Moisture Resistant; Length: 0.039inch; Width: 0.02inch; Height: 0.016inch; RoHS Compliant: Yes; ComponentLink1URL: http://www.yageo.com.tw/exep/pages/download/literatures/PYu-R_INT-thick_7.pdf?src-supplier=Digi-Key; ComponentLink1Description: http://www.yageo.com.tw/exep/pages/download/literatures/PYu-R_INT-thick_7.pdf?src-supplier=Digi-Key; Supplier Part Number 1: 603-RC0402DR-0727KL; LCSC Part Number: C138076